# Altium project RC notebook.PrjPcb
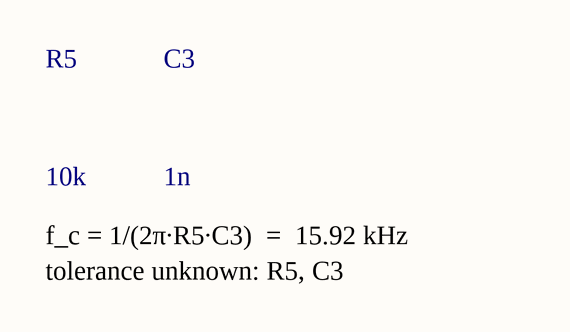
[diagram p0: Timing.SchDoc]
1 sheet, 2 parts. Net scope: global (net labels, ports and power ports of the same name join across sheets).

## Sheet Timing.SchDoc
size A4

### Parts
C3  1n
R5  10k

### Notes on the sheet
- f_c = 1/(2π·R5·C3)  =  15.92 kHz
- tolerance unknown: R5, C3

### Library data of the parts
C3 = Capacitor
R5 = Resistor